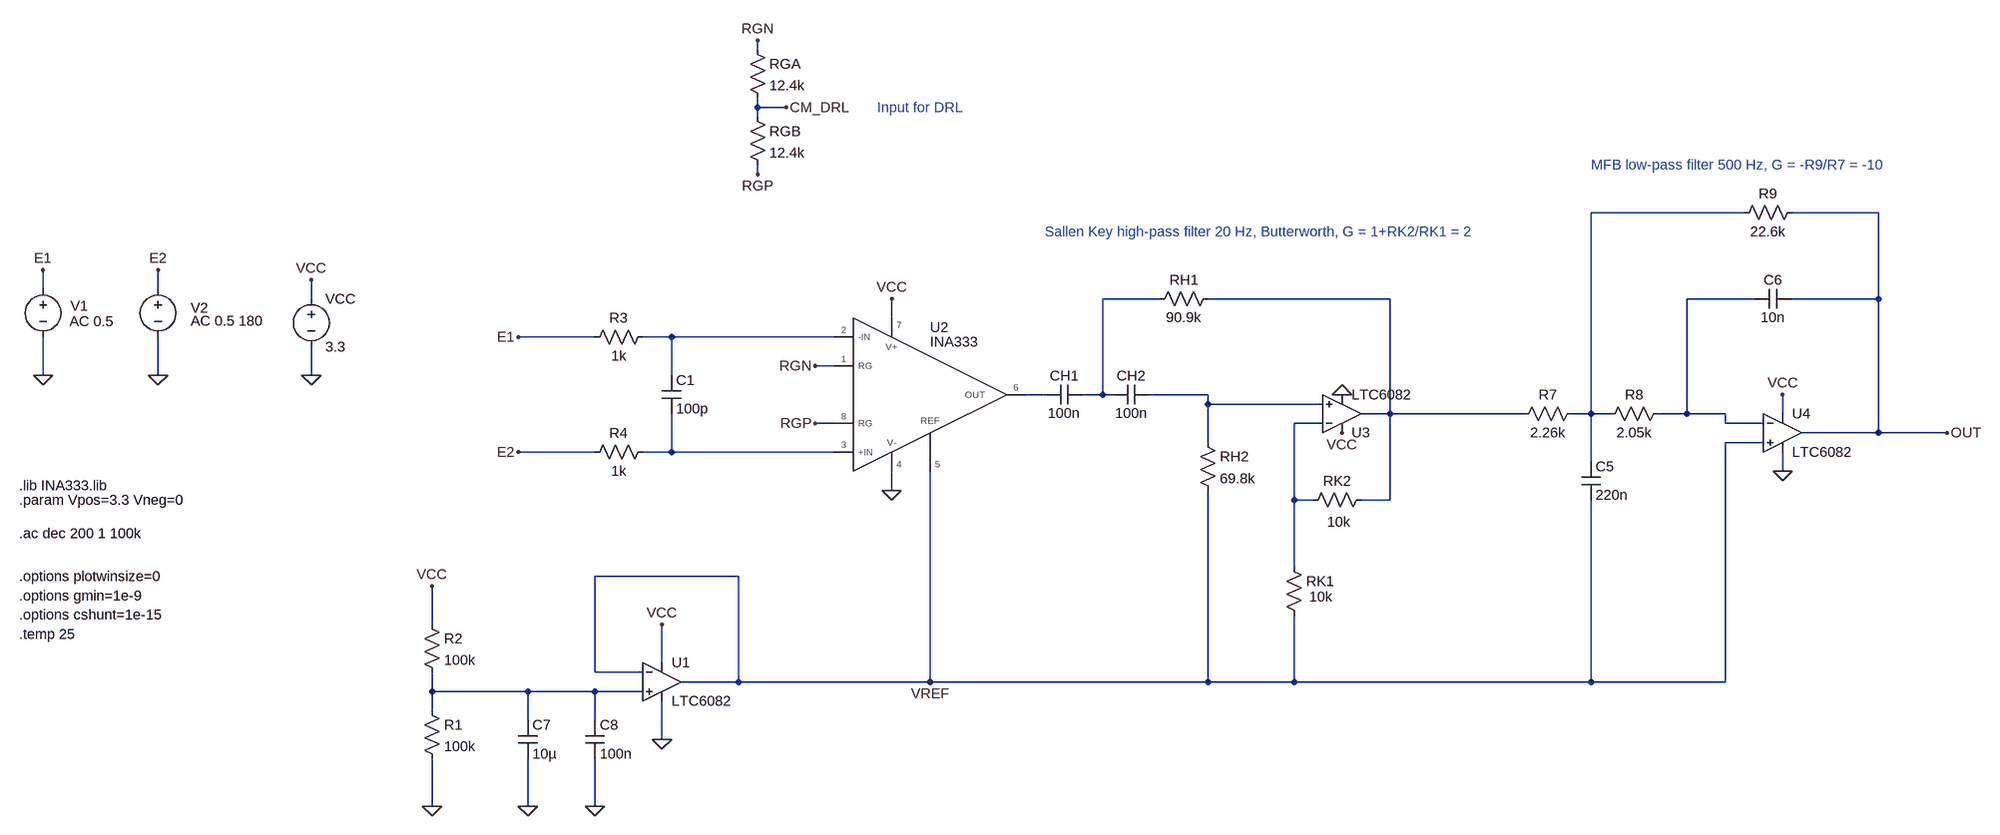
[diagram p0: schematic single_channel_emg.asc]
single_channel_emg.asc, the LTspice schematic file:
Version 4.1
SHEET 1 3144 1856
WIRE 848 -176 848 -192
WIRE 848 -80 848 -96
WIRE 896 -80 848 -80
WIRE 848 -64 848 -80
WIRE 848 32 848 16
WIRE 2496 96 2240 96
WIRE 2720 96 2576 96
WIRE -464 224 -464 192
WIRE -272 224 -272 192
WIRE -16 240 -16 208
WIRE 1520 240 1424 240
WIRE 1904 240 1600 240
WIRE 2512 240 2400 240
WIRE 2720 240 2720 96
WIRE 2720 240 2576 240
WIRE 1072 272 1072 240
WIRE 576 304 448 304
WIRE 704 304 656 304
WIRE 976 304 704 304
WIRE 976 352 944 352
WIRE -464 368 -464 304
WIRE -272 368 -272 304
WIRE -16 368 -16 320
WIRE 704 368 704 304
WIRE 1328 400 1296 400
WIRE 1424 400 1424 240
WIRE 1424 400 1392 400
WIRE 1440 400 1424 400
WIRE 1600 400 1504 400
WIRE 1600 416 1600 400
WIRE 1792 416 1600 416
WIRE 1904 432 1904 240
WIRE 1904 432 1856 432
WIRE 2128 432 1904 432
WIRE 2240 432 2240 96
WIRE 2240 432 2208 432
WIRE 2272 432 2240 432
WIRE 2400 432 2400 240
WIRE 2400 432 2352 432
WIRE 2464 432 2400 432
WIRE 2560 432 2560 400
WIRE 976 448 944 448
WIRE 1792 448 1744 448
WIRE 2464 448 2464 432
WIRE 2528 448 2464 448
WIRE 2720 464 2720 240
WIRE 2720 464 2592 464
WIRE 2848 464 2720 464
WIRE 1600 480 1600 416
WIRE 2528 480 2464 480
WIRE 576 496 448 496
WIRE 704 496 704 432
WIRE 704 496 656 496
WIRE 976 496 704 496
WIRE 2240 512 2240 432
WIRE 2560 528 2560 496
WIRE 1072 560 1072 528
WIRE 1744 576 1744 448
WIRE 1776 576 1744 576
WIRE 1904 576 1904 432
WIRE 1904 576 1856 576
WIRE 1744 688 1744 576
WIRE 816 704 576 704
WIRE 304 784 304 720
WIRE 688 848 688 784
WIRE 576 864 576 704
WIRE 656 864 576 864
WIRE 816 880 816 704
WIRE 816 880 720 880
WIRE 1136 880 1136 528
WIRE 1136 880 816 880
WIRE 1600 880 1600 560
WIRE 1600 880 1136 880
WIRE 1744 880 1744 768
WIRE 1744 880 1600 880
WIRE 2240 880 2240 576
WIRE 2240 880 1744 880
WIRE 2464 880 2464 480
WIRE 2464 880 2240 880
WIRE 304 896 304 864
WIRE 464 896 304 896
WIRE 576 896 464 896
WIRE 656 896 576 896
WIRE 304 928 304 896
WIRE 464 944 464 896
WIRE 576 944 576 896
WIRE 688 976 688 912
WIRE 304 1088 304 1008
WIRE 464 1088 464 1008
WIRE 576 1088 576 1008
FLAG 688 784 VCC
FLAG 1072 240 VCC
FLAG -16 208 VCC
FLAG -16 368 0
FLAG 688 976 0
FLAG 1072 560 0
FLAG -272 192 E2
FLAG -464 192 E1
FLAG 448 304 E1
FLAG 448 496 E2
FLAG 304 720 VCC
FLAG 304 1088 0
FLAG 2560 400 VCC
FLAG 2560 528 0
FLAG 2848 464 OUT
FLAG 464 1088 0
FLAG 576 1088 0
FLAG 944 352 RGN
FLAG 944 448 RGP
FLAG 848 -192 RGN
FLAG 848 32 RGP
FLAG 896 -80 CM_DRL
FLAG 1136 880 VREF
FLAG 1824 464 VCC
FLAG 1824 400 0
FLAG -272 368 0
FLAG -464 368 0
SYMBOL INA333 1072 400 R0
SYMATTR InstName U2
SYMBOL voltage -16 224 R0
WINDOW 123 0 0 Left 0
WINDOW 39 0 0 Left 0
SYMATTR InstName VCC
SYMATTR Value 3.3
SYMBOL voltage -464 208 R0
WINDOW 123 44 70 Left 2
WINDOW 39 0 0 Left 0
WINDOW 0 46 44 Left 2
SYMATTR Value2 AC 0.5
SYMATTR InstName V1
SYMATTR Value ""
SYMBOL voltage -272 208 R0
WINDOW 0 55 47 Left 2
WINDOW 123 55 69 Left 2
WINDOW 39 0 0 Left 0
SYMATTR InstName V2
SYMATTR Value2 AC 0.5 180
SYMATTR Value ""
SYMBOL res 288 912 R0
SYMATTR InstName R1
SYMATTR Value 100k
SYMBOL res 288 768 R0
SYMATTR InstName R2
SYMATTR Value 100k
SYMBOL res 672 288 R90
WINDOW 0 0 56 VBottom 2
WINDOW 3 32 56 VTop 2
SYMATTR InstName R3
SYMATTR Value 1k
SYMBOL res 672 480 R90
WINDOW 0 0 56 VBottom 2
WINDOW 3 32 56 VTop 2
SYMATTR InstName R4
SYMATTR Value 1k
SYMBOL cap 688 368 R0
SYMATTR InstName C1
SYMATTR Value 100p
SYMBOL res 832 -192 R0
SYMATTR InstName RGA
SYMATTR Value 12.4k
SYMBOL res 832 -80 R0
SYMATTR InstName RGB
SYMATTR Value 12.4k
SYMBOL cap 448 944 R0
SYMATTR InstName C7
SYMATTR Value 10µ
SYMBOL cap 560 944 R0
SYMATTR InstName C8
SYMATTR Value 100n
SYMBOL OpAmps\\LTC6082 688 880 R0
SYMATTR InstName U1
SYMBOL cap 1392 384 R90
WINDOW 0 0 32 VBottom 2
WINDOW 3 32 32 VTop 2
SYMATTR InstName CH1
SYMATTR Value 100n
SYMBOL cap 1504 384 R90
WINDOW 0 0 32 VBottom 2
WINDOW 3 32 32 VTop 2
SYMATTR InstName CH2
SYMATTR Value 100n
SYMBOL res 1616 224 R90
WINDOW 0 0 56 VBottom 2
WINDOW 3 32 56 VTop 2
SYMATTR InstName RH1
SYMATTR Value 90.9k
SYMBOL res 1584 464 R0
SYMATTR InstName RH2
SYMATTR Value 69.8k
SYMBOL res 1728 672 R0
WINDOW 3 41 66 Left 2
SYMATTR Value 10k
SYMATTR InstName RK1
SYMBOL res 1872 560 R90
WINDOW 0 0 56 VBottom 2
WINDOW 3 37 53 VTop 2
SYMATTR InstName RK2
SYMATTR Value 10k
SYMBOL OpAmps\\LTC6082 1824 432 M180
SYMATTR InstName U3
SYMBOL res 2224 416 R90
WINDOW 0 0 56 VBottom 2
WINDOW 3 32 56 VTop 2
SYMATTR InstName R7
SYMATTR Value 2.26k
SYMBOL res 2368 416 R90
WINDOW 0 0 56 VBottom 2
WINDOW 3 32 56 VTop 2
SYMATTR InstName R8
SYMATTR Value 2.05k
SYMBOL res 2592 80 R90
WINDOW 0 0 56 VBottom 2
WINDOW 3 32 56 VTop 2
SYMATTR InstName R9
SYMATTR Value 22.6k
SYMBOL cap 2224 512 R0
SYMATTR InstName C5
SYMATTR Value 220n
SYMBOL cap 2576 224 R90
WINDOW 0 0 32 VBottom 2
WINDOW 3 32 32 VTop 2
SYMATTR InstName C6
SYMATTR Value 10n
SYMBOL OpAmps\\LTC6082 2560 464 R0
SYMATTR InstName U4
TEXT -504 632 Left 2 !.ac dec 200 1 100k
TEXT -504 552 Left 2 !.lib INA333.lib
TEXT -504 576 Left 2 !.param Vpos=3.3 Vneg=0
TEXT -504 704 Left 2 !.options plotwinsize=0
TEXT -504 736 Left 2 !.options gmin=1e-9
TEXT -504 768 Left 2 !.options cshunt=1e-15
TEXT -504 800 Left 2 !.temp 25
TEXT 1328 128 Left 2 ;Sallen Key high-pass filter 20 Hz, Butterworth, G = 1+RK2/RK1 = 2
TEXT 2240 16 Left 2 ;MFB low-pass filter 500 Hz, G = -R9/R7 = -10
TEXT 1048 -80 Left 2 ;Input for DRL

The netlist it stands for:
* single_channel_emg.asc
X§U2 N009 N005 VCC 0 N006 VREF RGP RGN INA333  ; pins +IN -IN V+ V- OUT REF RG+ RG-
VCC VCC 0 3.3
V1 E1 0 AC 0.5
V2 E2 0 AC 0.5 180
R1 N010 0 100k
R2 VCC N010 100k
R3 N005 E1 1k
R4 N009 E2 1k
C1 N005 N009 100p
RGA RGN CM_DRL 12.4k
RGB CM_DRL RGP 12.4k
C7 N010 0 10µ
C8 N010 0 100n
* U1: LTC6082 (symbol OpAmps\LTC6082 not available, pins judged from their places): In+=N010 In-=VREF V+=VCC V-=0 OUT=VREF
CH1 N002 N006 100n
CH2 N007 N002 100n
RH1 N003 N002 90.9k
RH2 N007 VREF 69.8k
RK1 N008 VREF 10k
RK2 N003 N008 10k
* U3: LTC6082 (symbol OpAmps\LTC6082 not available, pins judged from their places): In+=N007 In-=N008 V+=VCC V-=0 OUT=N003
R7 N001 N003 2.26k
R8 N004 N001 2.05k
R9 OUT N001 22.6k
C5 N001 VREF 220n
C6 OUT N004 10n
* U4: LTC6082 (symbol OpAmps\LTC6082 not available, pins judged from their places): In+=VREF In-=N004 V+=VCC V-=0 OUT=OUT
.ac dec 200 1 100k
.lib INA333.lib
.param Vpos=3.3 Vneg=0
.options plotwinsize=0
.options gmin=1e-9
.options cshunt=1e-15
.temp 25
* Sallen Key high-pass filter 20 Hz, Butterworth, G = 1+RK2/RK1 = 2
* MFB low-pass filter 500 Hz, G = -R9/R7 = -10
* Input for DRL
.backanno
.end